# Altium schematic sheet allparts.SchDoc
size A4; SheetNumber: 2; SheetTotal: 5
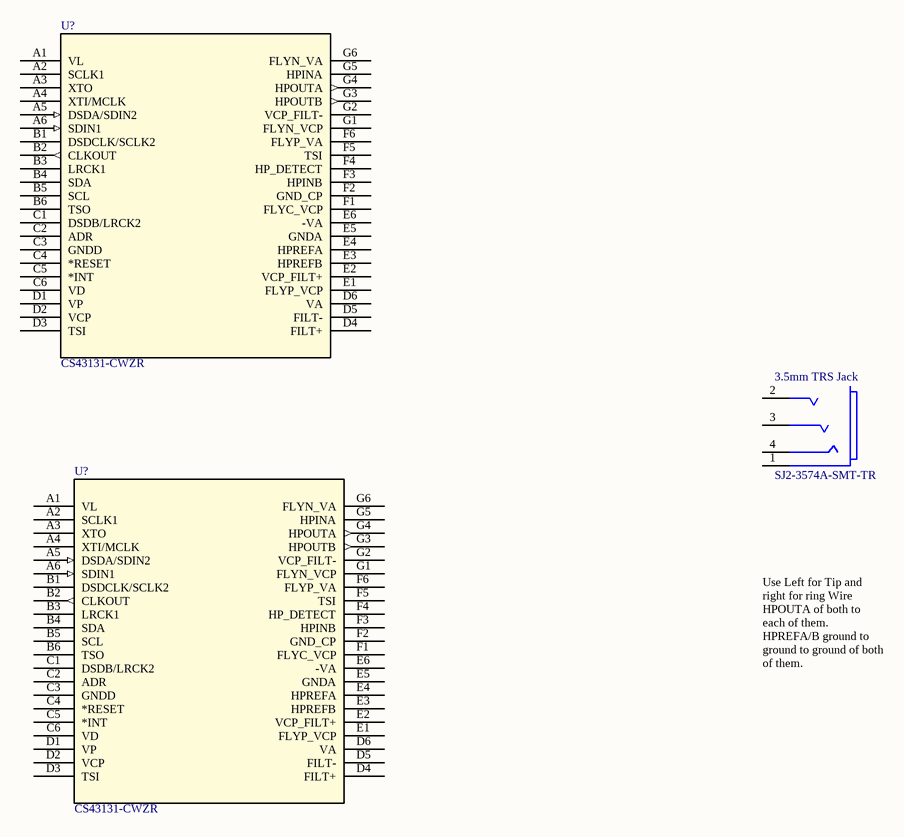
[diagram p0: allparts.SchDoc]

## Parts
(Parts that share a designator on the sheet are numbered #1, #2 ... from top to bottom, then left to right.)
3.5mm_TRS_Jack  SJ2-3574A-SMT-TR  [FP-SJ2-3574A-SMT-TR-MFG]
U?#1  CS43131-CWZR  [WLCSP42_CS43131-CWZR_CIR]
U?#2  CS43131-CWZR  [WLCSP42_CS43131-CWZR_CIR]

## Nets

Not connected (* = marked no-connect by the designer): 3.5mm_TRS_Jack 1(sleeve) 2(tip) 3(ring_1) 4(ring_2); U?#1 A1(VL) A2(SCLK1) A3(XTO) A4(XTI/MCLK) A5(DSDA/SDIN2) A6(SDIN1) B1(DSDCLK/SCLK2) B2(CLKOUT) B3(LRCK1) B4(SDA) B5(SCL) B6(TSO) C1(DSDB/LRCK2) C2(ADR) C3(GNDD) C4(*RESET) C5(*INT) C6(VD) D1(VP) D2(VCP) D3(TSI) D4(FILT+) D5(FILT-) D6(VA) E1(FLYP_VCP) E2(VCP_FILT+) E3(HPREFB) E4(HPREFA) E5(GNDA) E6(-VA) F1(FLYC_VCP) F2(GND_CP) F3(HPINB) F4(HP_DETECT) F5(TSI) F6(FLYP_VA) G1(FLYN_VCP) G2(VCP_FILT-) G3(HPOUTB) G4(HPOUTA) G5(HPINA) G6(FLYN_VA); U?#2 A1(VL) A2(SCLK1) A3(XTO) A4(XTI/MCLK) A5(DSDA/SDIN2) A6(SDIN1) B1(DSDCLK/SCLK2) B2(CLKOUT) B3(LRCK1) B4(SDA) B5(SCL) B6(TSO) C1(DSDB/LRCK2) C2(ADR) C3(GNDD) C4(*RESET) C5(*INT) C6(VD) D1(VP) D2(VCP) D3(TSI) D4(FILT+) D5(FILT-) D6(VA) E1(FLYP_VCP) E2(VCP_FILT+) E3(HPREFB) E4(HPREFA) E5(GNDA) E6(-VA) F1(FLYC_VCP) F2(GND_CP) F3(HPINB) F4(HP_DETECT) F5(TSI) F6(FLYP_VA) G1(FLYN_VCP) G2(VCP_FILT-) G3(HPOUTB) G4(HPOUTA) G5(HPINA) G6(FLYN_VA)

## Notes on the sheet
- Use Left for Tip and right for ring Wire HPOUTA of both to each of them. HPREFA/B ground to ground to ground of both of them.

## Library data of the parts
3.5mm_TRS_Jack = CMP-14818-000001-1: AUDIO JACK, 3.5 MM, RT, 4 CONDUC; Manufacturer: CUI; Conn Orientation: Horizontal; Current Rating: 1A; Number Of Contacts: 4; Voltage Rating: 12V; Package: SJ2-3574A-SMT-TR; Device Class L1: Connectors; Lead Free: Yes; Digikey Description: AUDIO JACK, 3.5 MM, RT, 4 CONDUC; Device Class L2: Audio / Video Connectors; ComponentLink2URL: https://www.cui.com/product/resource/sj2-357x-smt.pdf; Automotive: No; RoHS: TRUE; Height: 5.3mm; Temperature Range Low: -25°C; Category: Conn; Temperature: -25°C to +85°C; Octopart: https://octopart.com/sj2-3574a-smt-tr-cui-77838840; Device Class L3: unset; Contact Material: Silver; Manufacturer Part Number: SJ2-3574A-SMT-TR; Temperature Range High: +85°C; ComponentLink2Description: Datasheet
U?#1 U?#2 = CMP-057-000000-1: Description; Manufacturer_Name: Cirrus Logic; Design Item ID: CS43131-CWZR; RefDes: RefDes; Source: CS43131-CWZR.SchLib; Manufacturer_Part_Number: CS43131-CWZR; Type: Type; Copyright: Copyright (C) 2025 Ultra Librarian. All rights reserved.